# Altium schematic sheet Translator_I2C.SchDoc
size A3
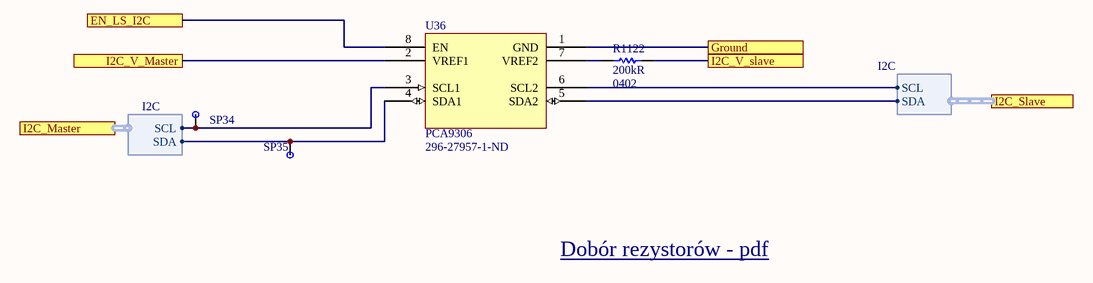
[diagram p0: Translator_I2C.SchDoc]

## Parts
R1122  200kR  Case/Package: 0402  [RES 0402/1005 RF KK]
SP34  SP  [MeasureTP]  (value not drawn)
SP35  SP  [MeasureTP]  (value not drawn)
U36  PCA9306  Supplier Part Number 1: 296-27957-1-ND  [PCA9306]

## Ports
EN_LS_I2C, Ground, I2C_Master (harness I2C), I2C_Slave (harness I2C), I2C_V_Master, I2C_V_slave

## Harnesses
I2C: SDA, SCL
I2C: SCL, SDA

## Nets
EN_LS_I2C: U36.8(EN) ; port EN_LS_I2C
Ground: U36.1(GND) ; port Ground
I2C_V_Master: U36.2(VREF1) ; port I2C_V_Master
I2C_V_slave: R1122.1 ; port I2C_V_slave
NetR1122_2: R1122.2 U36.7(VREF2)
NetSP34_1: SP34.1 U36.3(SCL1) ; port I2C_Master.SCL
NetSP35_1: SP35.1 U36.4(SDA1) ; port I2C_Master.SDA
NetU36_5: U36.5(SDA2) ; port I2C_Slave.SDA
NetU36_6: U36.6(SCL2) ; port I2C_Slave.SCL

## Notes on the sheet
- Dobór rezystorów - pdf <http://www.ti.com/lit/an/slva689/slva689.pdf>
- Title
- Size:
- Date:
- A3
- Number:
- Time:
- Revision:
- Sheet
- of
- File:

## Library data of the parts
R1122 = Resistor: Manufacturer: Vishay BCcomponents; Manufacturer Part Number: MCS04020C2003FE000; Tolerance: 1%; Temperature Coefficient: 50ppm/°C; Supplier 1: Digi-Key; Supplier Part Number 1: 749-1562-1-ND; Stock 1: 19500; Pricing 1: 1 = 0,29000, 10 = 0,24200, 100 = 0,09460, 1000 = 0,03960, 2500 = 0,03630, 5000 = 0,03300 (USD); RoHS: Yes; Contact Plating: Tin; Min Operating Temperature: -55°C; Max Operating Temperature: 125°C; Resistance: 200kR; Packaging: Tape and Reel; Composition: Thin Film; Military Standard: Not; Length: 1mm; Depth: 0.5mm; Width: 500um; Radiation Hardening: No; Lead Free: Lead Free; ComponentLink1URL: https://datasheet.ciiva.com/8899/mc-pro-8899257.pdf?src-supplier=Avnet; ComponentLink1Description: https://datasheet.ciiva.com/8899/mc-pro-8899257.pdf?src-supplier=Avnet; ComponentLink2URL: https://datasheet.ciiva.com/17167/mc-pro-17167599.pdf?src-supplier=Avnet+Europe; ComponentLink2Description: https://datasheet.ciiva.com/17167/mc-pro-17167599.pdf?src-supplier=Avnet+Europe
U36 = PCA9306: I2C [V] Level translator; Manufacturer: Texas Instruments; Manufacturer Part Number: PCA9306DQER; Max Supply Voltage: 5V; Min Supply Voltage: 0uV; Propagation Delay: 0.3ns; Number of Channels: 2; Turn-On Delay Time: 1.4ns; Low Level Output Current: 128mA; Supplier 1: Digi-Key; Stock 1: 43494; Pricing 1: 1 = 0,67000, 10 = 0,59100, 100 = 0,45340, 500 = 0,35844, 1000 = 0,28675 (USD); RoHS: Yes; Number of Pins: 8; Min Operating Temperature: -40°C; Max Operating Temperature: 85°C; Package Quantity: 1; Packaging: Tape and Reel; Logic Function: Translator; Number of Bits: 2; Output Type: I2C; Number of Outputs: 2; Length: 1.45mm; Height: 0.35mm; Width: 1.05mm; Radiation Hardening: No; Lead Free: Lead Free; REACH SVHC: No SVHC; ComponentLink1URL: https://datasheet.ciiva.com/1899/pca9306-1899328.pdf?src-supplier=Digi-Key; ComponentLink1Description: https://datasheet.ciiva.com/1899/pca9306-1899328.pdf?src-supplier=Digi-Key; ComponentLink2URL: https://datasheet.ciiva.com/22631/1719693-22631024.pdf?src-supplier=Element14; ComponentLink2Description: https://datasheet.ciiva.com/22631/1719693-22631024.pdf?src-supplier=Element14; ComponentLink3URL: https://datasheet.ciiva.com/15095/getdatasheetpartid-306496-15095555.pdf?src-supplier=Verical; ComponentLink3Description: https://datasheet.ciiva.com/15095/getdatasheetpartid-306496-15095555.pdf?src-supplier=Verical; ComponentLink4URL: https://datasheet.ciiva.com/1504/1862428-1504149.pdf?src-supplier=Element14; ComponentLink4Description: https://datasheet.ciiva.com/1504/1862428-1504149.pdf?src-supplier=Element14; ComponentLink5URL: https://datasheet.ciiva.com/26041/pca9306-26041014.pdf?src-supplier=Avnet+Europe; ComponentLink5Description: https://datasheet.ciiva.com/26041/pca9306-26041014.pdf?src-supplier=Avnet+Europe; ComponentLink6URL: https://datasheet.ciiva.com/14287/pca9306-14287374.pdf?src-supplier=Avnet; ComponentLink6Description: https://datasheet.ciiva.com/14287/pca9306-14287374.pdf?src-supplier=Avnet; ComponentLink7URL: https://datasheet.ciiva.com/1899/pca9306-1899326.pdf?src-supplier=Digi-Key; ComponentLink7Description: https://datasheet.ciiva.com/1899/pca9306-1899326.pdf?src-supplier=Digi-Key; ComponentLink8URL: https://datasheet.ciiva.com/14287/pca9306-14287470.pdf?src-supplier=Avnet; ComponentLink8Description: https://datasheet.ciiva.com/14287/pca9306-14287470.pdf?src-supplier=Avnet; ComponentLink9URL: https://datasheet.ciiva.com/1899/pca9306-1899327.pdf?src-supplier=Digi-Key; ComponentLink9Description: https://datasheet.ciiva.com/1899/pca9306-1899327.pdf?src-supplier=Digi-Key